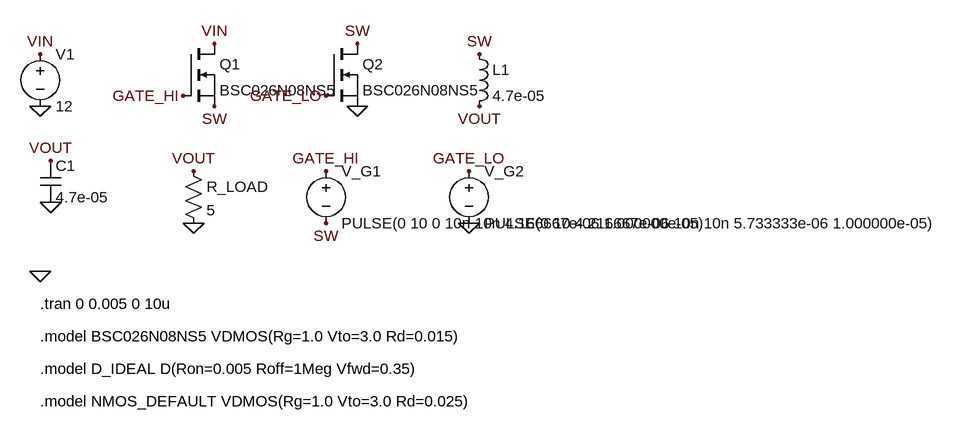
[diagram p0: schematic buck.asc]
buck.asc, the LTspice schematic file:
Version 4
SHEET 1 1400 900
SYMBOL voltage 100 100 R0
SYMATTR InstName V1
SYMATTR Value 12
FLAG 100 116 VIN
FLAG 100 196 0
SYMBOL nmos 320 100 R0
SYMATTR InstName Q1
SYMATTR Value BSC026N08NS5
FLAG 368 100 VIN
FLAG 320 180 GATE_HI
FLAG 368 196 SW
SYMBOL nmos 540 100 R0
SYMATTR InstName Q2
SYMATTR Value BSC026N08NS5
FLAG 588 100 SW
FLAG 540 180 GATE_LO
FLAG 588 196 0
SYMBOL ind 760 100 R0
SYMATTR InstName L1
SYMATTR Value 4.7e-05
FLAG 776 116 SW
FLAG 776 196 VOUT
SYMBOL cap 100 280 R0
SYMATTR InstName C1
SYMATTR Value 4.7e-05
FLAG 116 280 VOUT
FLAG 116 344 0
SYMBOL res 320 280 R0
SYMATTR InstName R_LOAD
SYMATTR Value 5
FLAG 336 296 VOUT
FLAG 336 376 0
SYMBOL voltage 540 280 R0
SYMATTR InstName V_G1
SYMATTR Value PULSE(0 10 0 10n 10n 4.166667e-06 1.000000e-05)
FLAG 540 296 GATE_HI
FLAG 540 376 SW
SYMBOL voltage 760 280 R0
SYMATTR InstName V_G2
SYMATTR Value PULSE(0 10 4.216667e-06 10n 10n 5.733333e-06 1.000000e-05)
FLAG 760 296 GATE_LO
FLAG 760 376 0
FLAG 100 450 0
TEXT 100 500 Left 2 !.tran 0 0.005 0 10u
TEXT 100 550 Left 2 !.model BSC026N08NS5 VDMOS(Rg=1.0 Vto=3.0 Rd=0.015)
TEXT 100 600 Left 2 !.model D_IDEAL D(Ron=0.005 Roff=1Meg Vfwd=0.35)
TEXT 100 650 Left 2 !.model NMOS_DEFAULT VDMOS(Rg=1.0 Vto=3.0 Rd=0.025)

The netlist it stands for:
* buck.asc
V1 VIN 0 12
M§Q1 VIN GATE_HI SW SW BSC026N08NS5
M§Q2 SW GATE_LO 0 0 BSC026N08NS5
L1 SW VOUT 4.7e-05
C1 VOUT 0 4.7e-05
R_LOAD VOUT 0 5
V_G1 GATE_HI SW PULSE(0 10 0 10n 10n 4.166667e-06 1.000000e-05)
V_G2 GATE_LO 0 PULSE(0 10 4.216667e-06 10n 10n 5.733333e-06 1.000000e-05)
.model NMOS NMOS
.model PMOS PMOS
.lib standard.mos
.tran 0 0.005 0 10u
.model BSC026N08NS5 VDMOS(Rg=1.0 Vto=3.0 Rd=0.015)
.model D_IDEAL D(Ron=0.005 Roff=1Meg Vfwd=0.35)
.model NMOS_DEFAULT VDMOS(Rg=1.0 Vto=3.0 Rd=0.025)
.backanno
.end